# Altium project EMG-Arm-ELEC-V2.0.PrjPcb (part 2 of 4)

## Sheet Electrode_Sheet2.SchDoc
size 420 x 297 mm
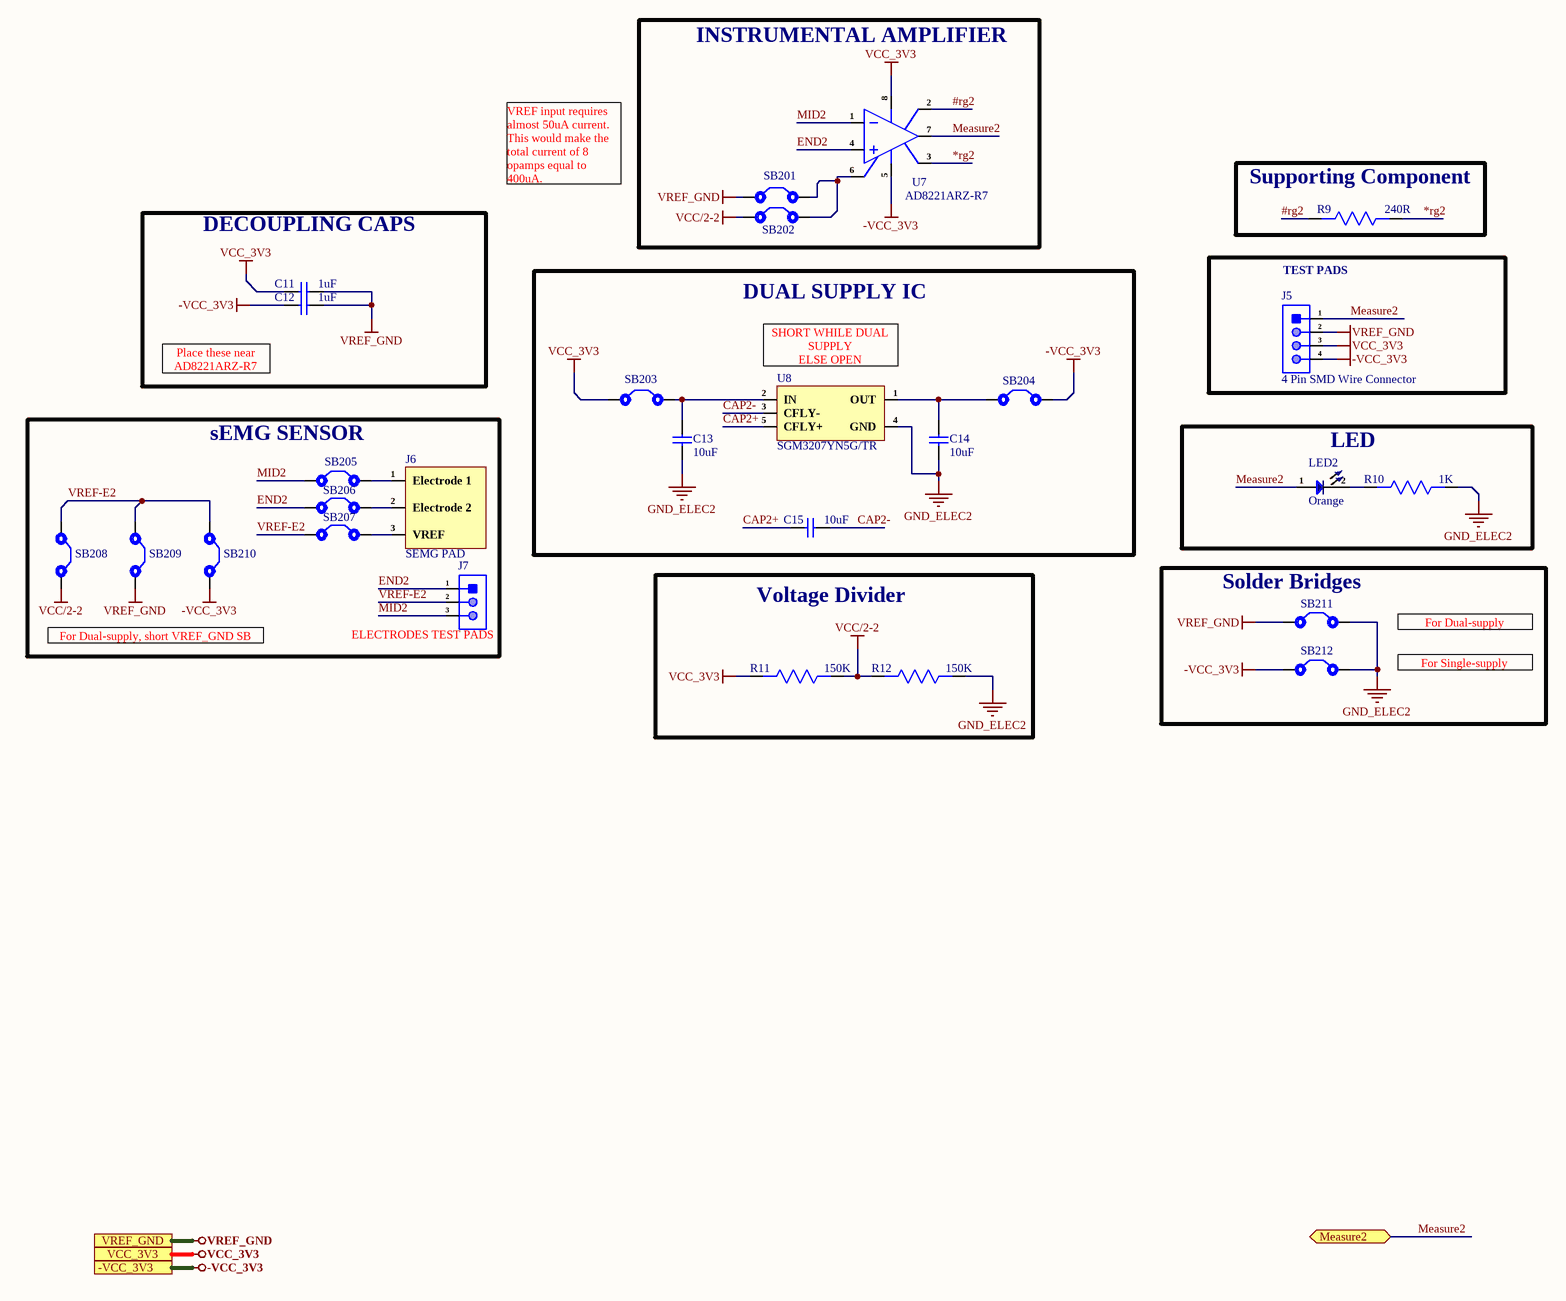
[diagram p4: Electrode_Sheet2.SchDoc]

### Parts
C11  1uF  [Cap-0402]
C12  1uF  [Cap-0402]
C13  10uF  [Cap-0603]
C14  10uF  [Cap-0603]
C15  10uF  [Cap-0603]
J5  4 Pin SMD Wire Connector  [4 Pin SMD Wire CON.]  (no BOM)
J6  SEMG PAD  [SEMG-PAD]
J7  Test Pad SMD 3 Pin  [Test Pad (SMD 3 Pin)]  (value not drawn)  (no BOM)
LED2  Orange  [LED-0603]
R9  240R  [Res-0402]
R10  1K  [Res-0402]
R11  150K  [Res-0402]
R12  150K  [Res-0402]
SB201  Solder Bridge 0402  [Solder Bridge 0402]  (value not drawn)  (no BOM)
SB202  Solder Bridge 0402  [Solder Bridge 0402]  (value not drawn)  (no BOM)
SB203  Solder Bridge 0402  [Solder Bridge 0402]  (value not drawn)  (no BOM)
SB204  Solder Bridge 0402  [Solder Bridge 0402]  (value not drawn)  (no BOM)
SB205  Solder Bridge 0402  [Solder Bridge 0402]  (value not drawn)  (no BOM)
SB206  Solder Bridge 0402  [Solder Bridge 0402]  (value not drawn)  (no BOM)
SB207  Solder Bridge 0402  [Solder Bridge 0402]  (value not drawn)  (no BOM)
SB208  Solder Bridge 0402  [Solder Bridge 0402]  (value not drawn)  (no BOM)
SB209  Solder Bridge 0402  [Solder Bridge 0402]  (value not drawn)  (no BOM)
SB210  Solder Bridge 0402  [Solder Bridge 0402]  (value not drawn)  (no BOM)
SB211  Solder Bridge 0402  [Solder Bridge 0402]  (value not drawn)  (no BOM)
SB212  Solder Bridge 0402  [Solder Bridge 0402]  (value not drawn)  (no BOM)
U7  AD8221ARZ-R7  [SOIC-8]
U8  SGM3207YN5G/TR  [SOT-23-5]

### Blocks framed on the sheet
INSTRUMENTAL AMPLIFIER: SB201 SB202 U7
Supporting Component: R9
DECOUPLING CAPS: C11 C12
TEST PADS: J5
DUAL SUPPLY IC: C13-C15 SB203 SB204 U8
sEMG SENSOR: J6 J7 SB205-SB210
LED: LED2 R10
Voltage Divider: R11 R12
Solder Bridges: SB211 SB212

### Ports
-VCC_3V3, Measure2 (bidir), VCC_3V3, VREF_GND

### Nets
-VCC_3V3: C12.1 J5.4 SB204.2 SB210.2 SB212.1 U7.5(V-) ; port -VCC_3V3
GND_ELEC2: C13.1 C14.1 R10.1 R12.2 SB211.2 SB212.2 U8.4(GND)
VCC/2-2: R11.2 R12.1 SB202.1 SB208.2
VCC_3V3: C11.1 J5.3 R11.1 SB203.1 U7.8(V+) ; port VCC_3V3
VREF_GND: C11.2 C12.2 J5.2 SB201.1 SB209.2 SB211.1 ; port VREF_GND
#rg2: R9.2 U7.2(RG)
*rg2: R9.1 U7.3(RG)
CAP2+: C15.1 U8.5(CFLY+)
CAP2-: C15.2 U8.3(CFLY-)
END2: J7.1 SB206.1 U7.4(IN+)
Measure2: J5.1 LED2.1 U7.7(VOUT) ; port Measure2
MID2: J7.3 SB205.1 U7.1(IN-)
VREF-E2: J7.2 SB207.1 SB208.1 SB209.1 SB210.1
NetC13_2: C13.2 SB203.2 U8.2(IN)
NetC14_2: C14.2 SB204.1 U8.1(OUT)
NetJ6_1: J6.1(Electrode_1) SB205.2
NetJ6_2: J6.2(Electrode_2) SB206.2
NetJ6_3: J6.3(VREF) SB207.2
NetLED2_2: LED2.2 R10.2
NetSB201_2: SB201.2 SB202.2 U7.6(REF)

### Notes on the sheet
- VREF input requires almost 50uA current. This would make the total current of 8 opamps equal to 400uA.
- Place these near AD8221ARZ-R7
- (near U8) SHORT WHILE DUAL SUPPLY
  ELSE OPEN
- For Dual-supply, short VREF_GND SB
- (near J7) ELECTRODES TEST PADS
- For Dual-supply
- For Single-supply
- File:
- Title:
- Date:
- Page
- Num:
- Total:
- Drawn By: Huzaifa Ali

### Library data of the parts
C11 C12 = CC0402KRX5R7BB105: CAP CER 1UF 16V X5R 0402; Manufacturer: Yageo; Tolerance: 10%; Item Type: Capacitor; Supplier 1: Digi-Key; Manufacturer Part Number: CC0402KRX5R7BB105; Stock 1: 1405667; Pricing 1: 1=0.36, 10=0.252, 100=0.1512, 500=0.1134, 1000=0.09576, 2500=0.09072, 5000=0.08568 (USD); Mount: Surface Mount; Case/Package: 0402; Weight: 2.3E-05oz; Case Code (Imperial): 0402; Case Code (Metric): 1005; Min Operating Temperature: -55°C; Max Operating Temperature: 85°C; Capacitance: 1uF; Dielectric: X5R; Packaging: Tape and Reel; Voltage Rating (DC): 16V; Voltage Rating: 16V; Termination: SMD/SMT; Composition: Ceramic; Length: 1mm; Height: 0.5mm; Width: 0.02inch; Thickness: 0.022inch; Depth: 0.5mm; Radiation Hardening: No; Lead Free: Lead Free; Halogen Free: Halogen Free; ComponentLink1URL: http://www.yageo.com/documents/recent/UPY-GPHC_X5R_4V-to-50V_12.pdf?src-supplier=Avnet+Europe; ComponentLink1Description: http://www.yageo.com/documents/recent/UPY-GPHC_X5R_4V-to-50V_12.pdf?src-supplier=Avnet+Europe; Supplier Part Number 1: 311-1691-6-ND; LCSC Part Number: C325464
C13-C15 = CL10A106MA8NRNC: CAP CER 10UF 25V X5R 0603; Manufacturer: Samsung; Tolerance: 20%; Supplier 1: Avnet; Manufacturer Part Number: CL10A106MA8NRNC; RoHS: Yes; Category: Ceramic Capacitors; Pricing 1: 4000=0.03753, 8000=0.03700, 16000=0.03595, 24000=0.03515, 32000=0.03383, 40000=0.03304, 400000=0.03225 (USD); Mount: Surface Mount; Case/Package: 0603; Case Code (Metric): 1608; Case Code (Imperial): 0603; Contact Plating: Tin; Min Operating Temperature: -55°C; Max Operating Temperature: 85°C; Package Quantity: 1; Packaging: Tape and Reel; Capacitance: 10uF; Voltage Rating: 25V; Dielectric: X5R; Termination: Wraparound; Series: CL; Construction: Flat; Length: 0.063inch; Width: 0.031inch; Thickness: 0.035inch; Lead Free: Lead Free; RoHS Compliant: Yes; ComponentLink1URL: https://datasheet.ciiva.com/25766/cl10a106ma8nrnc-25766562.pdf?src-supplier=Digi-Key; ComponentLink1Description: https://datasheet.ciiva.com/25766/cl10a106ma8nrnc-25766562.pdf?src-supplier=Digi-Key; Supplier Part Number 1: CL10A106MA8NRNC; LCSC Part Number: C96446
J5 = 4 Pin SMD Wire Connector: Wire Connecting Pads; Item Type: SMD Pads; Manufacturer Part Number: 4 Pin SMD Wire Connector
J6 = SEMG PAD: Sensor Connecting Pads
J7 = Test Pad SMD 3 Pin: Test Pad
LED2 = 19-217/S2C-AQ1R1B/3T: 0603(H=0.4mm) λD=600.5~612.5nm VR=5V VF=1.7V~2.2V IF=25mA PD=60mW; Manufacturer: Everlight; Item Type: LED; Supplier 1: Digi-Key; Manufacturer Part Number: 19-217/S2C-AQ1R1B/3T; RoHS: No; Category: LEDs; Supplier Part Number 1: 1080-19-217/S2C-AQ1R1B/3TTR-ND; LCSC Part Number: C146215; ComponentLink1Description: LCSC; ComponentLink1URL: https://www.lcsc.com/product-detail/Light-Emitting-Diodes-LED_Everlight-Elec-19-217-S2C-AQ1R1B-3T_C146215.html
R9 = RC0402FR-07240RL: RES 240 OHM 1% 1/16W 0402; Manufacturer: Yageo; Power Rating: 63mW; Temperature Coefficient: 100ppm/°C; Voltage Rating (DC): 50V; Supplier 1: Mouser; Manufacturer Part Number: RC0402FR-07240RL; RoHS: Yes; Category: Chip SMD Resistors; Stock 1: 1903202; Pricing 1: 1=0.10000, 10=0.01200, 50=0.01200, 100=0.00500, 1000=0.00300, 10000=0.00100 (USD); Case/Package: 0402; Case Code (Metric): 1005; Case Code (Imperial): 0402; Size Code: 0402; Min Operating Temperature: -55°C; Max Operating Temperature: 155°C; Resistance: 240R; Tolerance: 1%; Packaging: Tape and Reel; Resistor Type: Thick Film; Voltage Rating: 50V; Package Quantity: 1; Number of Terminations: 2; Termination: SMD/SMT; Max Power Dissipation: 63mW; Features: Moisture Resistant; Series: RC; Construction: Rectangular; Resistance Tolerance: 1%; Length: 1mm; Width: 0.02inch; Height: 0.016inch; Depth: 0.5mm; REACH SVHC: Unknown; Lead Free: Lead Free; RoHS Compliant: Yes; Military Standard: Not; ComponentLink1URL: https://datasheet.ciiva.com/7849/1018594-7849915.pdf?src-supplier=Element14; ComponentLink1Description: https://datasheet.ciiva.com/7849/1018594-7849915.pdf?src-supplier=Element14; ComponentLink2URL: https://datasheet.ciiva.com/7849/1018594-7849916.pdf?src-supplier=Element14; ComponentLink2Description: https://datasheet.ciiva.com/7849/1018594-7849916.pdf?src-supplier=Element14; ComponentLink3URL: https://datasheet.ciiva.com/2519/pyu-r-int-thick-7-2519157.pdf?src-supplier=Digi-Key; ComponentLink3Description: https://datasheet.ciiva.com/2519/pyu-r-int-thick-7-2519157.pdf?src-supplier=Digi-Key; ComponentLink4URL: https://datasheet.ciiva.com/2519/pyu-r-int-thick-7-2519158.pdf?src-supplier=Digi-Key; ComponentLink4Description: https://datasheet.ciiva.com/2519/pyu-r-int-thick-7-2519158.pdf?src-supplier=Digi-Key; ComponentLink5URL: https://datasheet.ciiva.com/2519/pyu-r-int-thick-7-2519156.pdf?src-supplier=Digi-Key; ComponentLink5Description: https://datasheet.ciiva.com/2519/pyu-r-int-thick-7-2519156.pdf?src-supplier=Digi-Key; ComponentLink6URL: https://datasheet.ciiva.com/12669/pyu-rc0402-51-rohs-l-6-r-12669689.pdf?src-supplier=Mouser; ComponentLink6Description: https://datasheet.ciiva.com/12669/pyu-rc0402-51-rohs-l-6-r-12669689.pdf?src-supplier=Mouser; ComponentLink7URL: https://datasheet.ciiva.com/17419/pyu-rc0402-51-rohs-l-6-r-17419482.pdf?src-supplier=Future+Electronics; ComponentLink7Description: https://datasheet.ciiva.com/17419/pyu-rc0402-51-rohs-l-6-r-17419482.pdf?src-supplier=Future+Electronics; Supplier Part Number 1: 603-RC0402FR-07240RL
R10 = RC0402JR-071KL: RES 1K OHM 5% 1/16W 0402; Manufacturer: Yageo; Resistance: 1kR; Power Rating: 62.5mW; Voltage Rating: 50V; Temperature Coefficient: 100ppm/°C; Max Power Dissipation: 63mW; Item Type: Resistor; Supplier 1: Digi-Key; Manufacturer Part Number: RC0402JR-071KL; RoHS: Yes; Category: Chip SMD Resistors; Stock 1: 452315; Pricing 1: 1=0.10000, 10=0.01300, 100=0.00540, 1000=0.00244, 2500=0.00212, 5000=0.00175 (USD); Case/Package: 0402; Case Code (Imperial): 0402; Case Code (Metric): 1005; Size Code: 0402; Min Operating Temperature: -55°C; Max Operating Temperature: 155°C; Tolerance: 5%; Packaging: Tape and Reel; Package Quantity: 1; Termination: SMD/SMT; Resistor Type: Thick Film; Number of Terminations: 2; Features: Moisture Resistant; Series: RC; Resistance Tolerance: 5%; Construction: Rectangular; Length: 0.039inch; Width: 0.02inch; Height: 0.016inch; Depth: 0.5mm; REACH SVHC: No SVHC; Military Standard: Not; Lead Free: Lead Free; RoHS Compliant: Yes; ComponentLink1URL: https://datasheet.ciiva.com/7983/1018594-7983558.pdf?src-supplier=Element14; ComponentLink1Description: https://datasheet.ciiva.com/7983/1018594-7983558.pdf?src-supplier=Element14; ComponentLink2URL: https://datasheet.ciiva.com/2452/pyu-r-int-thick-7-2452756.pdf?src-supplier=Digi-Key; ComponentLink2Description: https://datasheet.ciiva.com/2452/pyu-r-int-thick-7-2452756.pdf?src-supplier=Digi-Key; ComponentLink3URL: https://datasheet.ciiva.com/2452/pyu-r-int-thick-7-2452757.pdf?src-supplier=Digi-Key; ComponentLink3Description: https://datasheet.ciiva.com/2452/pyu-r-int-thick-7-2452757.pdf?src-supplier=Digi-Key; ComponentLink4URL: https://datasheet.ciiva.com/2452/pyu-r-int-thick-7-2452755.pdf?src-supplier=Digi-Key; ComponentLink4Description: https://datasheet.ciiva.com/2452/pyu-r-int-thick-7-2452755.pdf?src-supplier=Digi-Key; ComponentLink5URL: https://datasheet.ciiva.com/7850/1018594-7850170.pdf?src-supplier=Element14; ComponentLink5Description: https://datasheet.ciiva.com/7850/1018594-7850170.pdf?src-supplier=Element14; ComponentLink6URL: https://datasheet.ciiva.com/7850/1018594-7850171.pdf?src-supplier=Element14; ComponentLink6Description: https://datasheet.ciiva.com/7850/1018594-7850171.pdf?src-supplier=Element14; ComponentLink7URL: https://datasheet.ciiva.com/17081/pyu-rc0402-51-rohs-l-6-r-17081438.pdf?src-supplier=Future+Electronics; ComponentLink7Description: https://datasheet.ciiva.com/17081/pyu-rc0402-51-rohs-l-6-r-17081438.pdf?src-supplier=Future+Electronics; Supplier Part Number 1: 311-1.0KJRCT-ND; LCSC Part Number: C105637
R11 R12 = RC0402JR-07150KL: RES SMD 0402 150kOhm 5% Paper T/R; Manufacturer: Yageo; Resistance: 150kR; Power Rating: 63mW; Voltage Rating: 50V; Temperature Coefficient: 100ppm/°C; Item Type: Resistor; Supplier 1: Arrow Electronics; Manufacturer Part Number: RC0402JR-07150KL; RoHS: Yes; Category: Chip SMD Resistors; Stock 1: 170000; Pricing 1: 10000=0.00100 (USD); Case/Package: 0402; Case Code (Metric): 1005; Case Code (Imperial): 0402; Weight: 2.3E-05oz; Size Code: 0402; Min Operating Temperature: -55°C; Max Operating Temperature: 155°C; Package Quantity: 1; Tolerance: 5%; Packaging: Tape and Reel; Resistor Type: Thick Film; Number of Terminations: 2; Termination: SMD/SMT; Max Power Dissipation: 63mW; Features: Moisture Resistant; Series: RC; Construction: Rectangular; Resistance Tolerance: 5%; Length: 1mm; Width: 0.02inch; Height: 0.016inch; Depth: 0.5mm; REACH SVHC: No SVHC; Military Standard: Not; Lead Free: Lead Free; RoHS Compliant: Yes; ComponentLink1URL: https://datasheet.ciiva.com/7983/1018594-7983551.pdf?src-supplier=Element14; ComponentLink1Description: https://datasheet.ciiva.com/7983/1018594-7983551.pdf?src-supplier=Element14; ComponentLink2URL: https://datasheet.ciiva.com/2518/pyu-r-int-thick-7-2518929.pdf?src-supplier=Digi-Key; ComponentLink2Description: https://datasheet.ciiva.com/2518/pyu-r-int-thick-7-2518929.pdf?src-supplier=Digi-Key; ComponentLink3URL: https://datasheet.ciiva.com/2518/pyu-r-int-thick-7-2518930.pdf?src-supplier=Digi-Key; ComponentLink3Description: https://datasheet.ciiva.com/2518/pyu-r-int-thick-7-2518930.pdf?src-supplier=Digi-Key; ComponentLink4URL: https://datasheet.ciiva.com/2518/pyu-r-int-thick-7-2518928.pdf?src-supplier=Digi-Key; ComponentLink4Description: https://datasheet.ciiva.com/2518/pyu-r-int-thick-7-2518928.pdf?src-supplier=Digi-Key; ComponentLink5URL: https://datasheet.ciiva.com/7850/1018594-7850149.pdf?src-supplier=Element14; ComponentLink5Description: https://datasheet.ciiva.com/7850/1018594-7850149.pdf?src-supplier=Element14; ComponentLink6URL: https://datasheet.ciiva.com/17072/pyu-rc0402-51-rohs-l-6-r-17072379.pdf?src-supplier=Future+Electronics; ComponentLink6Description: https://datasheet.ciiva.com/17072/pyu-rc0402-51-rohs-l-6-r-17072379.pdf?src-supplier=Future+Electronics; ComponentLink7URL: https://datasheet.ciiva.com/15189/getdatasheetpartid-251830-15189543.pdf?src-supplier=Verical; ComponentLink7Description: https://datasheet.ciiva.com/15189/getdatasheetpartid-251830-15189543.pdf?src-supplier=Verical; Supplier Part Number 1: RC0402JR-07150KL; LCSC Part Number: C137919
SB201-SB212 = Solder Bridge 0402: Solder Bridge ON; Manufacturer Part Number: Solder Bridge 0402; Item Type: Solder Bridge
U7 = AD8221ARZ-R7: IC OPAMP INSTR 825KHZ 8SOIC; Manufacturer: Analog Devices; Number of Channels: 1; Common Mode Rejection Ratio: 80dB; Min Dual Supply Voltage: 2.3V; Max Dual Supply Voltage: 18V; Slew Rate: 2.5V/µs; Nominal Supply Current: 1mA; Max Power Dissipation: 200mW; Bandwidth: 562kHz; Input Bias Current: 1.5nA; Input Offset Voltage (Vos): 60uV; Output Current per Channel: 18mA; Power Supply Rejection Ratio (PSRR): 130dB; Voltage Gain: 60dB; Input Resistance: 100GR; Quiescent Current: 900uA; Operating Supply Voltage: 36V; Supplier 1: Mouser; Manufacturer Part Number: AD8221ARZ-R7; RoHS: Yes; Category: Amplifiers - Op Amps, Buffer, Instrumentation; Pricing 1: 1=7.37000, 10=6.66000, 25=6.35000, 50=6.35000, 100=5.51000, 250=5.27000, 500=4.80000, 1000=4.37000, 10000=4.37000 (USD); Case/Package: SOIC; Number of Pins: 8; Contact Plating: Tin,Matte; Min Operating Temperature: -40°C; Max Operating Temperature: 85°C; -3db Bandwidth: 825kHz; Package Quantity: 1000; Packaging: Tape and Reel; Number of Circuits: 1; Operating Supply Current: 1mA; Number of Elements: 1; Power Dissipation: 200mW; Series: -; Supply Current: 1mA; Radiation Hardening: No; Lead Free: Contains Lead; RoHS Compliant: Yes; ComponentLink1URL: https://datasheet.ciiva.com/15128/getdatasheetpartid-313520-15128733.pdf?src-supplier=Verical; ComponentLink1Description: https://datasheet.ciiva.com/15128/getdatasheetpartid-313520-15128733.pdf?src-supplier=Verical; ComponentLink2URL: https://datasheet.ciiva.com/2975/ad8221-2975658.pdf?src-supplier=Avnet; ComponentLink2Description: https://datasheet.ciiva.com/2975/ad8221-2975658.pdf?src-supplier=Avnet; ComponentLink3URL: https://datasheet.ciiva.com/2975/ad8221-2975980.pdf?src-supplier=Avnet; ComponentLink3Description: https://datasheet.ciiva.com/2975/ad8221-2975980.pdf?src-supplier=Avnet; ComponentLink4URL: https://datasheet.ciiva.com/6628/ad8221-6628618.pdf?src-supplier=Digi-Key; ComponentLink4Description: https://datasheet.ciiva.com/6628/ad8221-6628618.pdf?src-supplier=Digi-Key; ComponentLink5URL: https://datasheet.ciiva.com/6628/ad8221-6628619.pdf?src-supplier=Digi-Key; ComponentLink5Description: https://datasheet.ciiva.com/6628/ad8221-6628619.pdf?src-supplier=Digi-Key; ComponentLink6URL: https://datasheet.ciiva.com/6628/ad8221-6628617.pdf?src-supplier=Digi-Key; ComponentLink6Description: https://datasheet.ciiva.com/6628/ad8221-6628617.pdf?src-supplier=Digi-Key; ComponentLink7URL: https://datasheet.ciiva.com/48709/001249009-da-01-en-ic-amp-inst-prec-ad8221arz-r7-soic-8-adi-48709526.pdf?src-supplier=Conrad; ComponentLink7Description: https://datasheet.ciiva.com/48709/001249009-da-01-en-ic-amp-inst-prec-ad8221arz-r7-soic-8-adi-48709526.pdf?src-supplier=Conrad; Supplier Part Number 1: 584-AD8221ARZ-R7; LCSC Part Number: C13342; Item Type: IC
U8 = SGM3207YN5G/TR: NO Charge pump 1 -5.5V~-1.4V 1.4V~5.5V 60mA 19kHz SOT-23-5 DC-DC Converters ROHS; Manufacturer: SG Micro; Item Type: IC; Supplier 1: Avnet; Manufacturer Part Number: SGM3207YN5G/TR; RoHS: No; Category: Uncategorized; Pricing 1: 3000=0.38750, 6000=0.36250, 12000=0.33750, 18000=0.32500, 24000=0.31250, 30000=0.31250, 300000=0.30500 (USD); LCSC Part Number: C80403; Supplier Part Number 1: SGM3207YN5G/TR

## Sheet Electrode_Sheet3.SchDoc
size 420 x 297 mm
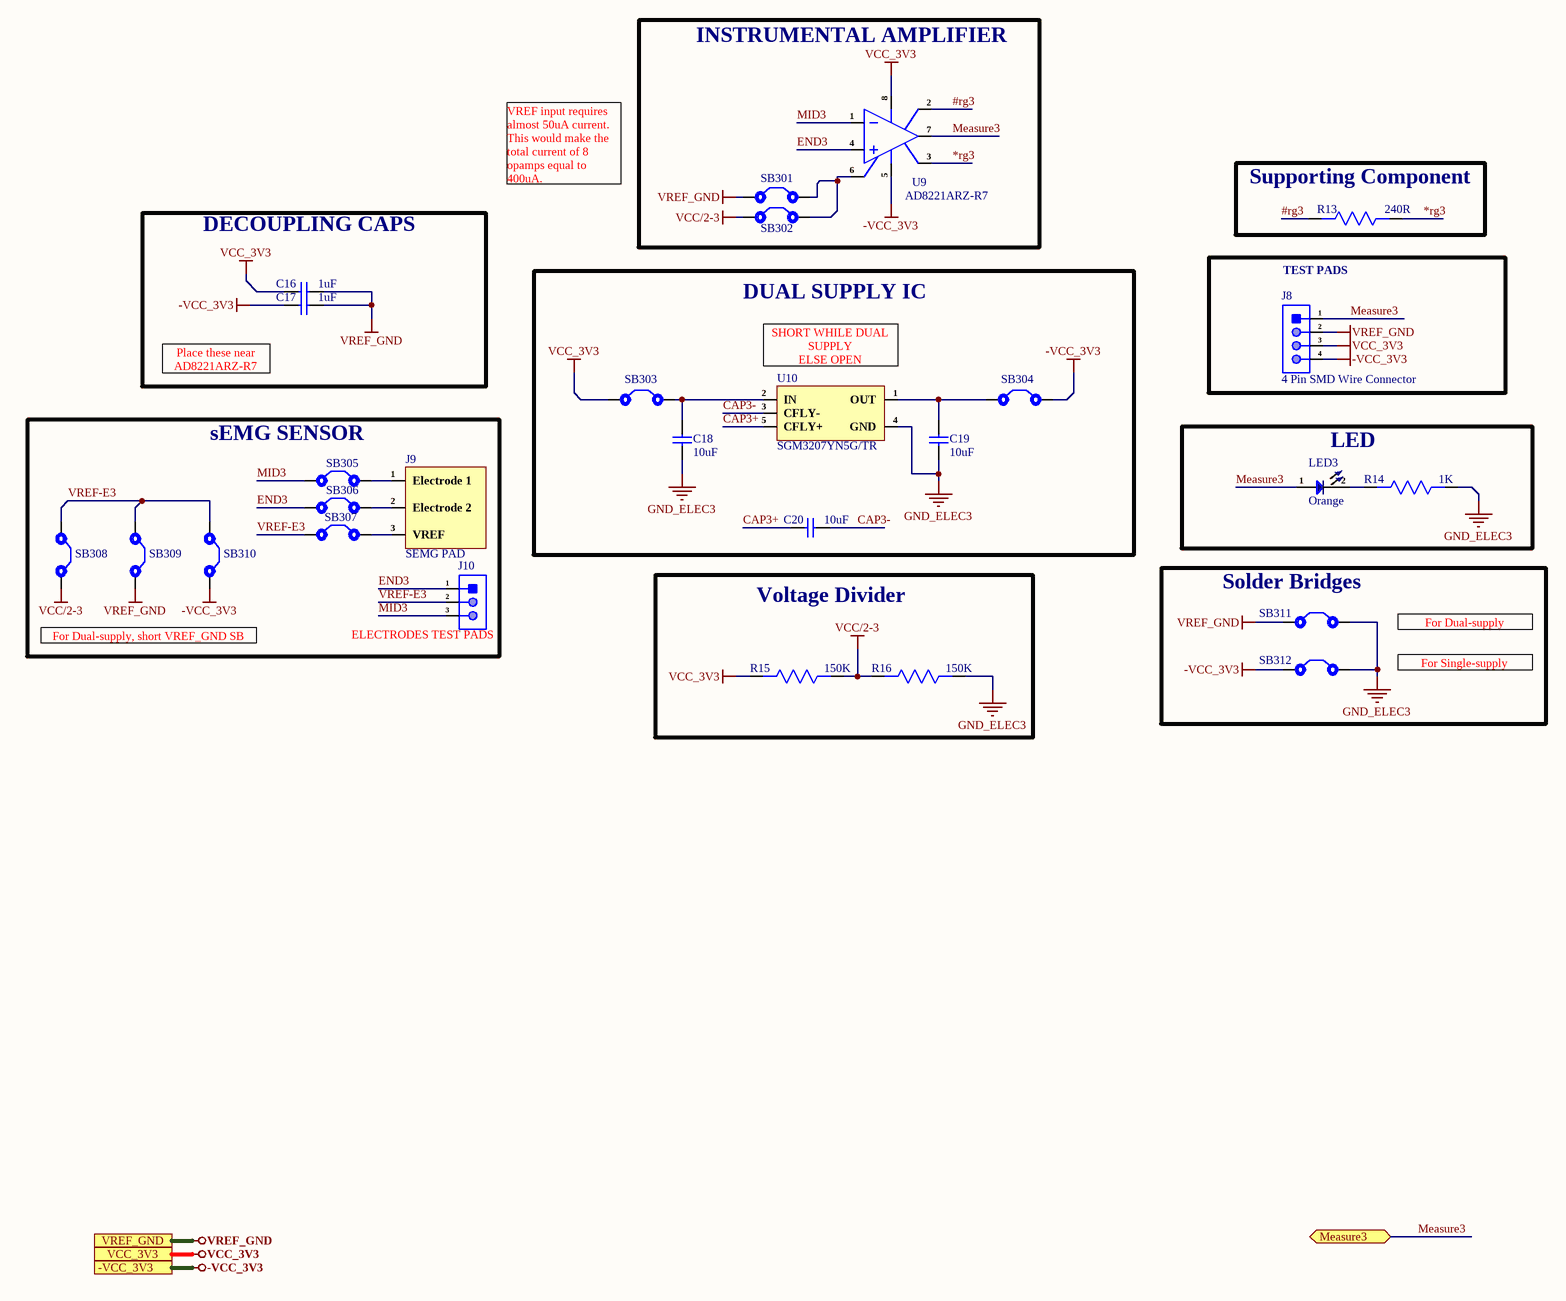
[diagram p5: Electrode_Sheet3.SchDoc]

### Parts
C16  1uF  [Cap-0402]
C17  1uF  [Cap-0402]
C18  10uF  [Cap-0603]
C19  10uF  [Cap-0603]
C20  10uF  [Cap-0603]
J8  4 Pin SMD Wire Connector  [4 Pin SMD Wire CON.]  (no BOM)
J9  SEMG PAD  [SEMG-PAD]
J10  Test Pad SMD 3 Pin  [Test Pad (SMD 3 Pin)]  (value not drawn)  (no BOM)
LED3  Orange  [LED-0603]
R13  240R  [Res-0402]
R14  1K  [Res-0402]
R15  150K  [Res-0402]
R16  150K  [Res-0402]
SB301  Solder Bridge 0402  [Solder Bridge 0402]  (value not drawn)  (no BOM)
SB302  Solder Bridge 0402  [Solder Bridge 0402]  (value not drawn)  (no BOM)
SB303  Solder Bridge 0402  [Solder Bridge 0402]  (value not drawn)  (no BOM)
SB304  Solder Bridge 0402  [Solder Bridge 0402]  (value not drawn)  (no BOM)
SB305  Solder Bridge 0402  [Solder Bridge 0402]  (value not drawn)  (no BOM)
SB306  Solder Bridge 0402  [Solder Bridge 0402]  (value not drawn)  (no BOM)
SB307  Solder Bridge 0402  [Solder Bridge 0402]  (value not drawn)  (no BOM)
SB308  Solder Bridge 0402  [Solder Bridge 0402]  (value not drawn)  (no BOM)
SB309  Solder Bridge 0402  [Solder Bridge 0402]  (value not drawn)  (no BOM)
SB310  Solder Bridge 0402  [Solder Bridge 0402]  (value not drawn)  (no BOM)
SB311  Solder Bridge 0402  [Solder Bridge 0402]  (value not drawn)  (no BOM)
SB312  Solder Bridge 0402  [Solder Bridge 0402]  (value not drawn)  (no BOM)
U9  AD8221ARZ-R7  [SOIC-8]
U10  SGM3207YN5G/TR  [SOT-23-5]

### Blocks framed on the sheet
INSTRUMENTAL AMPLIFIER: SB301 SB302 U9
Supporting Component: R13
DECOUPLING CAPS: C16 C17
TEST PADS: J8
DUAL SUPPLY IC: C18-C20 SB303 SB304 U10
sEMG SENSOR: J9 J10 SB305-SB310
LED: LED3 R14
Voltage Divider: R15 R16
Solder Bridges: SB311 SB312

### Ports
-VCC_3V3, Measure3 (bidir), VCC_3V3, VREF_GND

### Nets
-VCC_3V3: C17.1 J8.4 SB304.2 SB310.2 SB312.1 U9.5(V-) ; port -VCC_3V3
GND_ELEC3: C18.1 C19.1 R14.1 R16.2 SB311.2 SB312.2 U10.4(GND)
VCC/2-3: R15.2 R16.1 SB302.1 SB308.2
VCC_3V3: C16.1 J8.3 R15.1 SB303.1 U9.8(V+) ; port VCC_3V3
VREF_GND: C16.2 C17.2 J8.2 SB301.1 SB309.2 SB311.1 ; port VREF_GND
#rg3: R13.2 U9.2(RG)
*rg3: R13.1 U9.3(RG)
CAP3+: C20.1 U10.5(CFLY+)
CAP3-: C20.2 U10.3(CFLY-)
END3: J10.1 SB306.1 U9.4(IN+)
Measure3: J8.1 LED3.1 U9.7(VOUT) ; port Measure3
MID3: J10.3 SB305.1 U9.1(IN-)
VREF-E3: J10.2 SB307.1 SB308.1 SB309.1 SB310.1
NetC18_2: C18.2 SB303.2 U10.2(IN)
NetC19_2: C19.2 SB304.1 U10.1(OUT)
NetJ9_1: J9.1(Electrode_1) SB305.2
NetJ9_2: J9.2(Electrode_2) SB306.2
NetJ9_3: J9.3(VREF) SB307.2
NetLED3_2: LED3.2 R14.2
NetSB301_2: SB301.2 SB302.2 U9.6(REF)

### Notes on the sheet
- VREF input requires almost 50uA current. This would make the total current of 8 opamps equal to 400uA.
- Place these near AD8221ARZ-R7
- (near U10) SHORT WHILE DUAL SUPPLY
  ELSE OPEN
- For Dual-supply, short VREF_GND SB
- (near J10) ELECTRODES TEST PADS
- For Dual-supply
- For Single-supply
- File:
- Title:
- Date:
- Page
- Num:
- Total:
- Drawn By: Huzaifa Ali

### Library data of the parts
C16 C17 = CC0402KRX5R7BB105: as C11 on sheet Electrode_Sheet2; Supplier 1: Digi-Key; Manufacturer Part Number: CC0402KRX5R7BB105; Stock 1: 1405667; Pricing 1: 1=0.36, 10=0.252, 100=0.1512, 500=0.1134, 1000=0.09576, 2500=0.09072, 5000=0.08568 (USD); Mount: Surface Mount; Case/Package: 0402; Weight: 2.3E-05oz; Case Code (Imperial): 0402; Case Code (Metric): 1005; Min Operating Temperature: -55°C; Max Operating Temperature: 85°C; Capacitance: 1uF; Dielectric: X5R; Packaging: Tape and Reel; Voltage Rating (DC): 16V; Voltage Rating: 16V; Termination: SMD/SMT; Composition: Ceramic; Length: 1mm; Height: 0.5mm; Width: 0.02inch; Thickness: 0.022inch; Depth: 0.5mm; Radiation Hardening: No; Lead Free: Lead Free; Halogen Free: Halogen Free; ComponentLink1URL: http://www.yageo.com/documents/recent/UPY-GPHC_X5R_4V-to-50V_12.pdf?src-supplier=Avnet+Europe; ComponentLink1Description: http://www.yageo.com/documents/recent/UPY-GPHC_X5R_4V-to-50V_12.pdf?src-supplier=Avnet+Europe; Supplier Part Number 1: 311-1691-6-ND; LCSC Part Number: C325464
C18-C20 = CL10A106MA8NRNC: as C13 on sheet Electrode_Sheet2; Supplier 1: Avnet; Manufacturer Part Number: CL10A106MA8NRNC; RoHS: Yes; Category: Ceramic Capacitors; Pricing 1: 4000=0.03753, 8000=0.03700, 16000=0.03595, 24000=0.03515, 32000=0.03383, 40000=0.03304, 400000=0.03225 (USD); Mount: Surface Mount; Case/Package: 0603; Case Code (Metric): 1608; Case Code (Imperial): 0603; Contact Plating: Tin; Min Operating Temperature: -55°C; Max Operating Temperature: 85°C; Package Quantity: 1; Packaging: Tape and Reel; Capacitance: 10uF; Voltage Rating: 25V; Dielectric: X5R; Termination: Wraparound; Series: CL; Construction: Flat; Length: 0.063inch; Width: 0.031inch; Thickness: 0.035inch; Lead Free: Lead Free; RoHS Compliant: Yes; ComponentLink1URL: https://datasheet.ciiva.com/25766/cl10a106ma8nrnc-25766562.pdf?src-supplier=Digi-Key; ComponentLink1Description: https://datasheet.ciiva.com/25766/cl10a106ma8nrnc-25766562.pdf?src-supplier=Digi-Key; Supplier Part Number 1: CL10A106MA8NRNC; LCSC Part Number: C96446
J8 = 4 Pin SMD Wire Connector: as J5 on sheet Electrode_Sheet2; Manufacturer Part Number: 4 Pin SMD Wire Connector
J9 = SEMG PAD: Sensor Connecting Pads
J10 = Test Pad SMD 3 Pin: Test Pad
LED3 = 19-217/S2C-AQ1R1B/3T: as LED2 on sheet Electrode_Sheet2; Supplier 1: Digi-Key; Manufacturer Part Number: 19-217/S2C-AQ1R1B/3T; RoHS: No; Category: LEDs; Supplier Part Number 1: 1080-19-217/S2C-AQ1R1B/3TTR-ND; LCSC Part Number: C146215; ComponentLink1Description: LCSC; ComponentLink1URL: https://www.lcsc.com/product-detail/Light-Emitting-Diodes-LED_Everlight-Elec-19-217-S2C-AQ1R1B-3T_C146215.html
R13 = RC0402FR-07240RL: as R9 on sheet Electrode_Sheet2; Supplier 1: Mouser; Manufacturer Part Number: RC0402FR-07240RL; RoHS: Yes; Category: Chip SMD Resistors; Stock 1: 1903202; Pricing 1: 1=0.10000, 10=0.01200, 50=0.01200, 100=0.00500, 1000=0.00300, 10000=0.00100 (USD); Case/Package: 0402; Case Code (Metric): 1005; Case Code (Imperial): 0402; Size Code: 0402; Min Operating Temperature: -55°C; Max Operating Temperature: 155°C; Resistance: 240R; Tolerance: 1%; Packaging: Tape and Reel; Resistor Type: Thick Film; Voltage Rating: 50V; Package Quantity: 1; Number of Terminations: 2; Termination: SMD/SMT; Max Power Dissipation: 63mW; Features: Moisture Resistant; Series: RC; Construction: Rectangular; Resistance Tolerance: 1%; Length: 1mm; Width: 0.02inch; Height: 0.016inch; Depth: 0.5mm; REACH SVHC: Unknown; Lead Free: Lead Free; RoHS Compliant: Yes; Military Standard: Not; ComponentLink1URL: https://datasheet.ciiva.com/7849/1018594-7849915.pdf?src-supplier=Element14; ComponentLink1Description: https://datasheet.ciiva.com/7849/1018594-7849915.pdf?src-supplier=Element14; ComponentLink2URL: https://datasheet.ciiva.com/7849/1018594-7849916.pdf?src-supplier=Element14; ComponentLink2Description: https://datasheet.ciiva.com/7849/1018594-7849916.pdf?src-supplier=Element14; ComponentLink3URL: https://datasheet.ciiva.com/2519/pyu-r-int-thick-7-2519157.pdf?src-supplier=Digi-Key; ComponentLink3Description: https://datasheet.ciiva.com/2519/pyu-r-int-thick-7-2519157.pdf?src-supplier=Digi-Key; ComponentLink4URL: https://datasheet.ciiva.com/2519/pyu-r-int-thick-7-2519158.pdf?src-supplier=Digi-Key; ComponentLink4Description: https://datasheet.ciiva.com/2519/pyu-r-int-thick-7-2519158.pdf?src-supplier=Digi-Key; ComponentLink5URL: https://datasheet.ciiva.com/2519/pyu-r-int-thick-7-2519156.pdf?src-supplier=Digi-Key; ComponentLink5Description: https://datasheet.ciiva.com/2519/pyu-r-int-thick-7-2519156.pdf?src-supplier=Digi-Key; ComponentLink6URL: https://datasheet.ciiva.com/12669/pyu-rc0402-51-rohs-l-6-r-12669689.pdf?src-supplier=Mouser; ComponentLink6Description: https://datasheet.ciiva.com/12669/pyu-rc0402-51-rohs-l-6-r-12669689.pdf?src-supplier=Mouser; ComponentLink7URL: https://datasheet.ciiva.com/17419/pyu-rc0402-51-rohs-l-6-r-17419482.pdf?src-supplier=Future+Electronics; ComponentLink7Description: https://datasheet.ciiva.com/17419/pyu-rc0402-51-rohs-l-6-r-17419482.pdf?src-supplier=Future+Electronics; Supplier Part Number 1: 603-RC0402FR-07240RL
R14 = RC0402JR-071KL: as R10 on sheet Electrode_Sheet2; Supplier 1: Digi-Key; Manufacturer Part Number: RC0402JR-071KL; RoHS: Yes; Category: Chip SMD Resistors; Stock 1: 452315; Pricing 1: 1=0.10000, 10=0.01300, 100=0.00540, 1000=0.00244, 2500=0.00212, 5000=0.00175 (USD); Case/Package: 0402; Case Code (Imperial): 0402; Case Code (Metric): 1005; Size Code: 0402; Min Operating Temperature: -55°C; Max Operating Temperature: 155°C; Tolerance: 5%; Packaging: Tape and Reel; Package Quantity: 1; Termination: SMD/SMT; Resistor Type: Thick Film; Number of Terminations: 2; Features: Moisture Resistant; Series: RC; Resistance Tolerance: 5%; Construction: Rectangular; Length: 0.039inch; Width: 0.02inch; Height: 0.016inch; Depth: 0.5mm; REACH SVHC: No SVHC; Military Standard: Not; Lead Free: Lead Free; RoHS Compliant: Yes; ComponentLink1URL: https://datasheet.ciiva.com/7983/1018594-7983558.pdf?src-supplier=Element14; ComponentLink1Description: https://datasheet.ciiva.com/7983/1018594-7983558.pdf?src-supplier=Element14; ComponentLink2URL: https://datasheet.ciiva.com/2452/pyu-r-int-thick-7-2452756.pdf?src-supplier=Digi-Key; ComponentLink2Description: https://datasheet.ciiva.com/2452/pyu-r-int-thick-7-2452756.pdf?src-supplier=Digi-Key; ComponentLink3URL: https://datasheet.ciiva.com/2452/pyu-r-int-thick-7-2452757.pdf?src-supplier=Digi-Key; ComponentLink3Description: https://datasheet.ciiva.com/2452/pyu-r-int-thick-7-2452757.pdf?src-supplier=Digi-Key; ComponentLink4URL: https://datasheet.ciiva.com/2452/pyu-r-int-thick-7-2452755.pdf?src-supplier=Digi-Key; ComponentLink4Description: https://datasheet.ciiva.com/2452/pyu-r-int-thick-7-2452755.pdf?src-supplier=Digi-Key; ComponentLink5URL: https://datasheet.ciiva.com/7850/1018594-7850170.pdf?src-supplier=Element14; ComponentLink5Description: https://datasheet.ciiva.com/7850/1018594-7850170.pdf?src-supplier=Element14; ComponentLink6URL: https://datasheet.ciiva.com/7850/1018594-7850171.pdf?src-supplier=Element14; ComponentLink6Description: https://datasheet.ciiva.com/7850/1018594-7850171.pdf?src-supplier=Element14; ComponentLink7URL: https://datasheet.ciiva.com/17081/pyu-rc0402-51-rohs-l-6-r-17081438.pdf?src-supplier=Future+Electronics; ComponentLink7Description: https://datasheet.ciiva.com/17081/pyu-rc0402-51-rohs-l-6-r-17081438.pdf?src-supplier=Future+Electronics; Supplier Part Number 1: 311-1.0KJRCT-ND; LCSC Part Number: C105637
R15 R16 = RC0402JR-07150KL: as R11 on sheet Electrode_Sheet2; Supplier 1: Arrow Electronics; Manufacturer Part Number: RC0402JR-07150KL; RoHS: Yes; Category: Chip SMD Resistors; Stock 1: 170000; Pricing 1: 10000=0.00100 (USD); Case/Package: 0402; Case Code (Metric): 1005; Case Code (Imperial): 0402; Weight: 2.3E-05oz; Size Code: 0402; Min Operating Temperature: -55°C; Max Operating Temperature: 155°C; Package Quantity: 1; Tolerance: 5%; Packaging: Tape and Reel; Resistor Type: Thick Film; Number of Terminations: 2; Termination: SMD/SMT; Max Power Dissipation: 63mW; Features: Moisture Resistant; Series: RC; Construction: Rectangular; Resistance Tolerance: 5%; Length: 1mm; Width: 0.02inch; Height: 0.016inch; Depth: 0.5mm; REACH SVHC: No SVHC; Military Standard: Not; Lead Free: Lead Free; RoHS Compliant: Yes; ComponentLink1URL: https://datasheet.ciiva.com/7983/1018594-7983551.pdf?src-supplier=Element14; ComponentLink1Description: https://datasheet.ciiva.com/7983/1018594-7983551.pdf?src-supplier=Element14; ComponentLink2URL: https://datasheet.ciiva.com/2518/pyu-r-int-thick-7-2518929.pdf?src-supplier=Digi-Key; ComponentLink2Description: https://datasheet.ciiva.com/2518/pyu-r-int-thick-7-2518929.pdf?src-supplier=Digi-Key; ComponentLink3URL: https://datasheet.ciiva.com/2518/pyu-r-int-thick-7-2518930.pdf?src-supplier=Digi-Key; ComponentLink3Description: https://datasheet.ciiva.com/2518/pyu-r-int-thick-7-2518930.pdf?src-supplier=Digi-Key; ComponentLink4URL: https://datasheet.ciiva.com/2518/pyu-r-int-thick-7-2518928.pdf?src-supplier=Digi-Key; ComponentLink4Description: https://datasheet.ciiva.com/2518/pyu-r-int-thick-7-2518928.pdf?src-supplier=Digi-Key; ComponentLink5URL: https://datasheet.ciiva.com/7850/1018594-7850149.pdf?src-supplier=Element14; ComponentLink5Description: https://datasheet.ciiva.com/7850/1018594-7850149.pdf?src-supplier=Element14; ComponentLink6URL: https://datasheet.ciiva.com/17072/pyu-rc0402-51-rohs-l-6-r-17072379.pdf?src-supplier=Future+Electronics; ComponentLink6Description: https://datasheet.ciiva.com/17072/pyu-rc0402-51-rohs-l-6-r-17072379.pdf?src-supplier=Future+Electronics; ComponentLink7URL: https://datasheet.ciiva.com/15189/getdatasheetpartid-251830-15189543.pdf?src-supplier=Verical; ComponentLink7Description: https://datasheet.ciiva.com/15189/getdatasheetpartid-251830-15189543.pdf?src-supplier=Verical; Supplier Part Number 1: RC0402JR-07150KL; LCSC Part Number: C137919
SB301-SB312 = Solder Bridge 0402: Solder Bridge ON; Manufacturer Part Number: Solder Bridge 0402; Item Type: Solder Bridge
U9 = AD8221ARZ-R7: as U7 on sheet Electrode_Sheet2; Supplier 1: Mouser; Manufacturer Part Number: AD8221ARZ-R7; RoHS: Yes; Category: Amplifiers - Op Amps, Buffer, Instrumentation; Pricing 1: 1=7.37000, 10=6.66000, 25=6.35000, 50=6.35000, 100=5.51000, 250=5.27000, 500=4.80000, 1000=4.37000, 10000=4.37000 (USD); Case/Package: SOIC; Number of Pins: 8; Contact Plating: Tin,Matte; Min Operating Temperature: -40°C; Max Operating Temperature: 85°C; -3db Bandwidth: 825kHz; Package Quantity: 1000; Packaging: Tape and Reel; Number of Circuits: 1; Operating Supply Current: 1mA; Number of Elements: 1; Power Dissipation: 200mW; Series: -; Supply Current: 1mA; Radiation Hardening: No; Lead Free: Contains Lead; RoHS Compliant: Yes; ComponentLink1URL: https://datasheet.ciiva.com/15128/getdatasheetpartid-313520-15128733.pdf?src-supplier=Verical; ComponentLink1Description: https://datasheet.ciiva.com/15128/getdatasheetpartid-313520-15128733.pdf?src-supplier=Verical; ComponentLink2URL: https://datasheet.ciiva.com/2975/ad8221-2975658.pdf?src-supplier=Avnet; ComponentLink2Description: https://datasheet.ciiva.com/2975/ad8221-2975658.pdf?src-supplier=Avnet; ComponentLink3URL: https://datasheet.ciiva.com/2975/ad8221-2975980.pdf?src-supplier=Avnet; ComponentLink3Description: https://datasheet.ciiva.com/2975/ad8221-2975980.pdf?src-supplier=Avnet; ComponentLink4URL: https://datasheet.ciiva.com/6628/ad8221-6628618.pdf?src-supplier=Digi-Key; ComponentLink4Description: https://datasheet.ciiva.com/6628/ad8221-6628618.pdf?src-supplier=Digi-Key; ComponentLink5URL: https://datasheet.ciiva.com/6628/ad8221-6628619.pdf?src-supplier=Digi-Key; ComponentLink5Description: https://datasheet.ciiva.com/6628/ad8221-6628619.pdf?src-supplier=Digi-Key; ComponentLink6URL: https://datasheet.ciiva.com/6628/ad8221-6628617.pdf?src-supplier=Digi-Key; ComponentLink6Description: https://datasheet.ciiva.com/6628/ad8221-6628617.pdf?src-supplier=Digi-Key; ComponentLink7URL: https://datasheet.ciiva.com/48709/001249009-da-01-en-ic-amp-inst-prec-ad8221arz-r7-soic-8-adi-48709526.pdf?src-supplier=Conrad; ComponentLink7Description: https://datasheet.ciiva.com/48709/001249009-da-01-en-ic-amp-inst-prec-ad8221arz-r7-soic-8-adi-48709526.pdf?src-supplier=Conrad; Supplier Part Number 1: 584-AD8221ARZ-R7; LCSC Part Number: C13342; Item Type: IC
U10 = SGM3207YN5G/TR: as U8 on sheet Electrode_Sheet2; Supplier 1: Avnet; Manufacturer Part Number: SGM3207YN5G/TR; RoHS: No; Category: Uncategorized; Pricing 1: 3000=0.38750, 6000=0.36250, 12000=0.33750, 18000=0.32500, 24000=0.31250, 30000=0.31250, 300000=0.30500 (USD); LCSC Part Number: C80403; Supplier Part Number 1: SGM3207YN5G/TR

## Sheet Electrode_Sheet4.SchDoc
size 420 x 297 mm
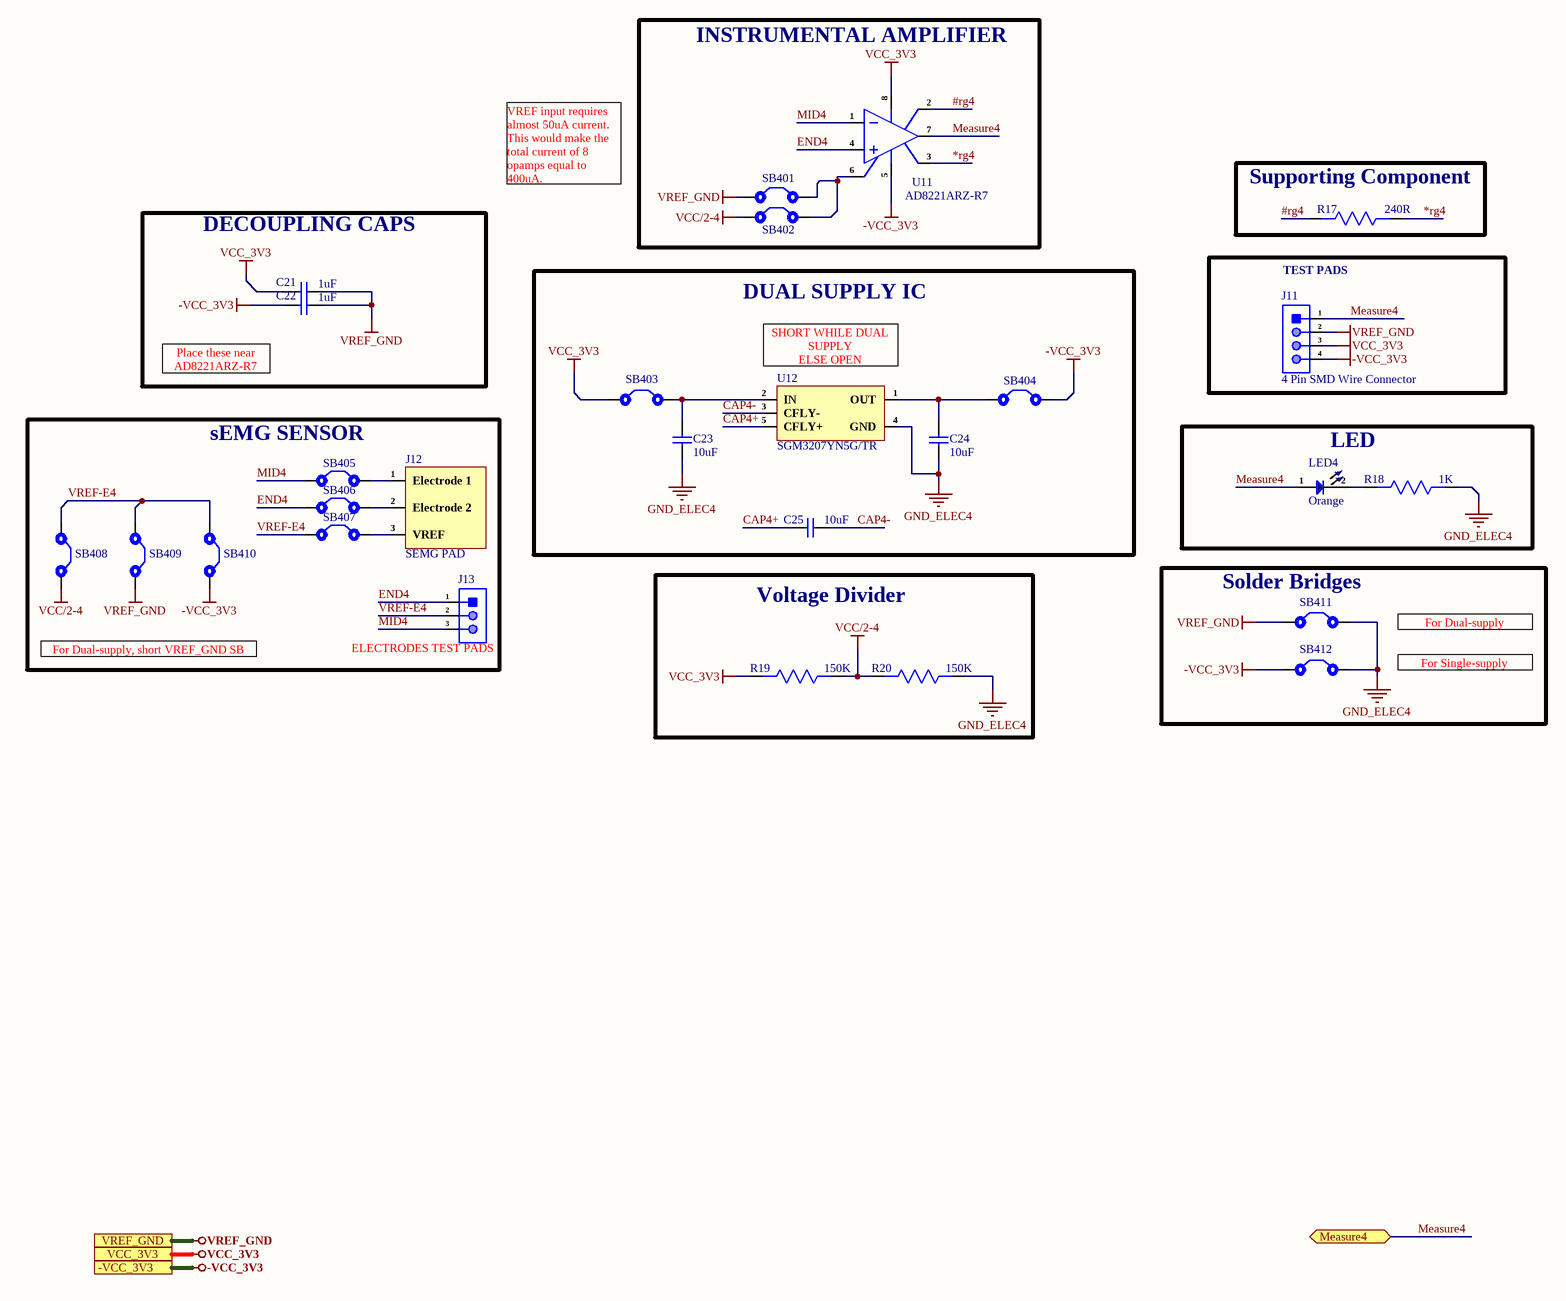
[diagram p6: Electrode_Sheet4.SchDoc]

### Parts
C21  1uF  [Cap-0402]
C22  1uF  [Cap-0402]
C23  10uF  [Cap-0603]
C24  10uF  [Cap-0603]
C25  10uF  [Cap-0603]
J11  4 Pin SMD Wire Connector  [4 Pin SMD Wire CON.]  (no BOM)
J12  SEMG PAD  [SEMG-PAD]
J13  Test Pad SMD 3 Pin  [Test Pad (SMD 3 Pin)]  (value not drawn)  (no BOM)
LED4  Orange  [LED-0603]
R17  240R  [Res-0402]
R18  1K  [Res-0402]
R19  150K  [Res-0402]
R20  150K  [Res-0402]
SB401  Solder Bridge 0402  [Solder Bridge 0402]  (value not drawn)  (no BOM)
SB402  Solder Bridge 0402  [Solder Bridge 0402]  (value not drawn)  (no BOM)
SB403  Solder Bridge 0402  [Solder Bridge 0402]  (value not drawn)  (no BOM)
SB404  Solder Bridge 0402  [Solder Bridge 0402]  (value not drawn)  (no BOM)
SB405  Solder Bridge 0402  [Solder Bridge 0402]  (value not drawn)  (no BOM)
SB406  Solder Bridge 0402  [Solder Bridge 0402]  (value not drawn)  (no BOM)
SB407  Solder Bridge 0402  [Solder Bridge 0402]  (value not drawn)  (no BOM)
SB408  Solder Bridge 0402  [Solder Bridge 0402]  (value not drawn)  (no BOM)
SB409  Solder Bridge 0402  [Solder Bridge 0402]  (value not drawn)  (no BOM)
SB410  Solder Bridge 0402  [Solder Bridge 0402]  (value not drawn)  (no BOM)
SB411  Solder Bridge 0402  [Solder Bridge 0402]  (value not drawn)  (no BOM)
SB412  Solder Bridge 0402  [Solder Bridge 0402]  (value not drawn)  (no BOM)
U11  AD8221ARZ-R7  [SOIC-8]
U12  SGM3207YN5G/TR  [SOT-23-5]

### Blocks framed on the sheet
INSTRUMENTAL AMPLIFIER: SB401 SB402 U11
Supporting Component: R17
DECOUPLING CAPS: C21 C22
TEST PADS: J11
DUAL SUPPLY IC: C23-C25 SB403 SB404 U12
sEMG SENSOR: J12 J13 SB405-SB410
LED: LED4 R18
Voltage Divider: R19 R20
Solder Bridges: SB411 SB412

### Ports
-VCC_3V3, Measure4 (bidir), VCC_3V3, VREF_GND

### Nets
-VCC_3V3: C22.1 J11.4 SB404.2 SB410.2 SB412.1 U11.5(V-) ; port -VCC_3V3
GND_ELEC4: C23.1 C24.1 R18.1 R20.2 SB411.2 SB412.2 U12.4(GND)
VCC/2-4: R19.2 R20.1 SB402.1 SB408.2
VCC_3V3: C21.1 J11.3 R19.1 SB403.1 U11.8(V+) ; port VCC_3V3
VREF_GND: C21.2 C22.2 J11.2 SB401.1 SB409.2 SB411.1 ; port VREF_GND
#rg4: R17.2 U11.2(RG)
*rg4: R17.1 U11.3(RG)
CAP4+: C25.1 U12.5(CFLY+)
CAP4-: C25.2 U12.3(CFLY-)
END4: J13.1 SB406.1 U11.4(IN+)
Measure4: J11.1 LED4.1 U11.7(VOUT) ; port Measure4
MID4: J13.3 SB405.1 U11.1(IN-)
VREF-E4: J13.2 SB407.1 SB408.1 SB409.1 SB410.1
NetC23_2: C23.2 SB403.2 U12.2(IN)
NetC24_2: C24.2 SB404.1 U12.1(OUT)
NetJ12_1: J12.1(Electrode_1) SB405.2
NetJ12_2: J12.2(Electrode_2) SB406.2
NetJ12_3: J12.3(VREF) SB407.2
NetLED4_2: LED4.2 R18.2
NetSB401_2: SB401.2 SB402.2 U11.6(REF)

### Notes on the sheet
- VREF input requires almost 50uA current. This would make the total current of 8 opamps equal to 400uA.
- Place these near AD8221ARZ-R7
- (near U12) SHORT WHILE DUAL SUPPLY
  ELSE OPEN
- For Dual-supply, short VREF_GND SB
- (near J13) ELECTRODES TEST PADS
- For Dual-supply
- For Single-supply
- File:
- Title:
- Date:
- Page
- Num:
- Total:
- Drawn By: Huzaifa Ali

### Library data of the parts
C21 C22 = CC0402KRX5R7BB105: as C11 on sheet Electrode_Sheet2; Supplier 1: Digi-Key; Manufacturer Part Number: CC0402KRX5R7BB105; Stock 1: 1405667; Pricing 1: 1=0.36, 10=0.252, 100=0.1512, 500=0.1134, 1000=0.09576, 2500=0.09072, 5000=0.08568 (USD); Mount: Surface Mount; Case/Package: 0402; Weight: 2.3E-05oz; Case Code (Imperial): 0402; Case Code (Metric): 1005; Min Operating Temperature: -55°C; Max Operating Temperature: 85°C; Capacitance: 1uF; Dielectric: X5R; Packaging: Tape and Reel; Voltage Rating (DC): 16V; Voltage Rating: 16V; Termination: SMD/SMT; Composition: Ceramic; Length: 1mm; Height: 0.5mm; Width: 0.02inch; Thickness: 0.022inch; Depth: 0.5mm; Radiation Hardening: No; Lead Free: Lead Free; Halogen Free: Halogen Free; ComponentLink1URL: http://www.yageo.com/documents/recent/UPY-GPHC_X5R_4V-to-50V_12.pdf?src-supplier=Avnet+Europe; ComponentLink1Description: http://www.yageo.com/documents/recent/UPY-GPHC_X5R_4V-to-50V_12.pdf?src-supplier=Avnet+Europe; Supplier Part Number 1: 311-1691-6-ND; LCSC Part Number: C325464
C23-C25 = CL10A106MA8NRNC: as C13 on sheet Electrode_Sheet2; Supplier 1: Avnet; Manufacturer Part Number: CL10A106MA8NRNC; RoHS: Yes; Category: Ceramic Capacitors; Pricing 1: 4000=0.03753, 8000=0.03700, 16000=0.03595, 24000=0.03515, 32000=0.03383, 40000=0.03304, 400000=0.03225 (USD); Mount: Surface Mount; Case/Package: 0603; Case Code (Metric): 1608; Case Code (Imperial): 0603; Contact Plating: Tin; Min Operating Temperature: -55°C; Max Operating Temperature: 85°C; Package Quantity: 1; Packaging: Tape and Reel; Capacitance: 10uF; Voltage Rating: 25V; Dielectric: X5R; Termination: Wraparound; Series: CL; Construction: Flat; Length: 0.063inch; Width: 0.031inch; Thickness: 0.035inch; Lead Free: Lead Free; RoHS Compliant: Yes; ComponentLink1URL: https://datasheet.ciiva.com/25766/cl10a106ma8nrnc-25766562.pdf?src-supplier=Digi-Key; ComponentLink1Description: https://datasheet.ciiva.com/25766/cl10a106ma8nrnc-25766562.pdf?src-supplier=Digi-Key; Supplier Part Number 1: CL10A106MA8NRNC; LCSC Part Number: C96446
J11 = 4 Pin SMD Wire Connector: as J5 on sheet Electrode_Sheet2; Manufacturer Part Number: 4 Pin SMD Wire Connector
J12 = SEMG PAD: Sensor Connecting Pads
J13 = Test Pad SMD 3 Pin: Test Pad
LED4 = 19-217/S2C-AQ1R1B/3T: as LED2 on sheet Electrode_Sheet2; Supplier 1: Digi-Key; Manufacturer Part Number: 19-217/S2C-AQ1R1B/3T; RoHS: No; Category: LEDs; Supplier Part Number 1: 1080-19-217/S2C-AQ1R1B/3TTR-ND; LCSC Part Number: C146215; ComponentLink1Description: LCSC; ComponentLink1URL: https://www.lcsc.com/product-detail/Light-Emitting-Diodes-LED_Everlight-Elec-19-217-S2C-AQ1R1B-3T_C146215.html
R17 = RC0402FR-07240RL: as R9 on sheet Electrode_Sheet2; Supplier 1: Mouser; Manufacturer Part Number: RC0402FR-07240RL; RoHS: Yes; Category: Chip SMD Resistors; Stock 1: 1903202; Pricing 1: 1=0.10000, 10=0.01200, 50=0.01200, 100=0.00500, 1000=0.00300, 10000=0.00100 (USD); Case/Package: 0402; Case Code (Metric): 1005; Case Code (Imperial): 0402; Size Code: 0402; Min Operating Temperature: -55°C; Max Operating Temperature: 155°C; Resistance: 240R; Tolerance: 1%; Packaging: Tape and Reel; Resistor Type: Thick Film; Voltage Rating: 50V; Package Quantity: 1; Number of Terminations: 2; Termination: SMD/SMT; Max Power Dissipation: 63mW; Features: Moisture Resistant; Series: RC; Construction: Rectangular; Resistance Tolerance: 1%; Length: 1mm; Width: 0.02inch; Height: 0.016inch; Depth: 0.5mm; REACH SVHC: Unknown; Lead Free: Lead Free; RoHS Compliant: Yes; Military Standard: Not; ComponentLink1URL: https://datasheet.ciiva.com/7849/1018594-7849915.pdf?src-supplier=Element14; ComponentLink1Description: https://datasheet.ciiva.com/7849/1018594-7849915.pdf?src-supplier=Element14; ComponentLink2URL: https://datasheet.ciiva.com/7849/1018594-7849916.pdf?src-supplier=Element14; ComponentLink2Description: https://datasheet.ciiva.com/7849/1018594-7849916.pdf?src-supplier=Element14; ComponentLink3URL: https://datasheet.ciiva.com/2519/pyu-r-int-thick-7-2519157.pdf?src-supplier=Digi-Key; ComponentLink3Description: https://datasheet.ciiva.com/2519/pyu-r-int-thick-7-2519157.pdf?src-supplier=Digi-Key; ComponentLink4URL: https://datasheet.ciiva.com/2519/pyu-r-int-thick-7-2519158.pdf?src-supplier=Digi-Key; ComponentLink4Description: https://datasheet.ciiva.com/2519/pyu-r-int-thick-7-2519158.pdf?src-supplier=Digi-Key; ComponentLink5URL: https://datasheet.ciiva.com/2519/pyu-r-int-thick-7-2519156.pdf?src-supplier=Digi-Key; ComponentLink5Description: https://datasheet.ciiva.com/2519/pyu-r-int-thick-7-2519156.pdf?src-supplier=Digi-Key; ComponentLink6URL: https://datasheet.ciiva.com/12669/pyu-rc0402-51-rohs-l-6-r-12669689.pdf?src-supplier=Mouser; ComponentLink6Description: https://datasheet.ciiva.com/12669/pyu-rc0402-51-rohs-l-6-r-12669689.pdf?src-supplier=Mouser; ComponentLink7URL: https://datasheet.ciiva.com/17419/pyu-rc0402-51-rohs-l-6-r-17419482.pdf?src-supplier=Future+Electronics; ComponentLink7Description: https://datasheet.ciiva.com/17419/pyu-rc0402-51-rohs-l-6-r-17419482.pdf?src-supplier=Future+Electronics; Supplier Part Number 1: 603-RC0402FR-07240RL
R18 = RC0402JR-071KL: as R10 on sheet Electrode_Sheet2; Supplier 1: Digi-Key; Manufacturer Part Number: RC0402JR-071KL; RoHS: Yes; Category: Chip SMD Resistors; Stock 1: 452315; Pricing 1: 1=0.10000, 10=0.01300, 100=0.00540, 1000=0.00244, 2500=0.00212, 5000=0.00175 (USD); Case/Package: 0402; Case Code (Imperial): 0402; Case Code (Metric): 1005; Size Code: 0402; Min Operating Temperature: -55°C; Max Operating Temperature: 155°C; Tolerance: 5%; Packaging: Tape and Reel; Package Quantity: 1; Termination: SMD/SMT; Resistor Type: Thick Film; Number of Terminations: 2; Features: Moisture Resistant; Series: RC; Resistance Tolerance: 5%; Construction: Rectangular; Length: 0.039inch; Width: 0.02inch; Height: 0.016inch; Depth: 0.5mm; REACH SVHC: No SVHC; Military Standard: Not; Lead Free: Lead Free; RoHS Compliant: Yes; ComponentLink1URL: https://datasheet.ciiva.com/7983/1018594-7983558.pdf?src-supplier=Element14; ComponentLink1Description: https://datasheet.ciiva.com/7983/1018594-7983558.pdf?src-supplier=Element14; ComponentLink2URL: https://datasheet.ciiva.com/2452/pyu-r-int-thick-7-2452756.pdf?src-supplier=Digi-Key; ComponentLink2Description: https://datasheet.ciiva.com/2452/pyu-r-int-thick-7-2452756.pdf?src-supplier=Digi-Key; ComponentLink3URL: https://datasheet.ciiva.com/2452/pyu-r-int-thick-7-2452757.pdf?src-supplier=Digi-Key; ComponentLink3Description: https://datasheet.ciiva.com/2452/pyu-r-int-thick-7-2452757.pdf?src-supplier=Digi-Key; ComponentLink4URL: https://datasheet.ciiva.com/2452/pyu-r-int-thick-7-2452755.pdf?src-supplier=Digi-Key; ComponentLink4Description: https://datasheet.ciiva.com/2452/pyu-r-int-thick-7-2452755.pdf?src-supplier=Digi-Key; ComponentLink5URL: https://datasheet.ciiva.com/7850/1018594-7850170.pdf?src-supplier=Element14; ComponentLink5Description: https://datasheet.ciiva.com/7850/1018594-7850170.pdf?src-supplier=Element14; ComponentLink6URL: https://datasheet.ciiva.com/7850/1018594-7850171.pdf?src-supplier=Element14; ComponentLink6Description: https://datasheet.ciiva.com/7850/1018594-7850171.pdf?src-supplier=Element14; ComponentLink7URL: https://datasheet.ciiva.com/17081/pyu-rc0402-51-rohs-l-6-r-17081438.pdf?src-supplier=Future+Electronics; ComponentLink7Description: https://datasheet.ciiva.com/17081/pyu-rc0402-51-rohs-l-6-r-17081438.pdf?src-supplier=Future+Electronics; Supplier Part Number 1: 311-1.0KJRCT-ND; LCSC Part Number: C105637
R19 R20 = RC0402JR-07150KL: as R11 on sheet Electrode_Sheet2; Supplier 1: Arrow Electronics; Manufacturer Part Number: RC0402JR-07150KL; RoHS: Yes; Category: Chip SMD Resistors; Stock 1: 170000; Pricing 1: 10000=0.00100 (USD); Case/Package: 0402; Case Code (Metric): 1005; Case Code (Imperial): 0402; Weight: 2.3E-05oz; Size Code: 0402; Min Operating Temperature: -55°C; Max Operating Temperature: 155°C; Package Quantity: 1; Tolerance: 5%; Packaging: Tape and Reel; Resistor Type: Thick Film; Number of Terminations: 2; Termination: SMD/SMT; Max Power Dissipation: 63mW; Features: Moisture Resistant; Series: RC; Construction: Rectangular; Resistance Tolerance: 5%; Length: 1mm; Width: 0.02inch; Height: 0.016inch; Depth: 0.5mm; REACH SVHC: No SVHC; Military Standard: Not; Lead Free: Lead Free; RoHS Compliant: Yes; ComponentLink1URL: https://datasheet.ciiva.com/7983/1018594-7983551.pdf?src-supplier=Element14; ComponentLink1Description: https://datasheet.ciiva.com/7983/1018594-7983551.pdf?src-supplier=Element14; ComponentLink2URL: https://datasheet.ciiva.com/2518/pyu-r-int-thick-7-2518929.pdf?src-supplier=Digi-Key; ComponentLink2Description: https://datasheet.ciiva.com/2518/pyu-r-int-thick-7-2518929.pdf?src-supplier=Digi-Key; ComponentLink3URL: https://datasheet.ciiva.com/2518/pyu-r-int-thick-7-2518930.pdf?src-supplier=Digi-Key; ComponentLink3Description: https://datasheet.ciiva.com/2518/pyu-r-int-thick-7-2518930.pdf?src-supplier=Digi-Key; ComponentLink4URL: https://datasheet.ciiva.com/2518/pyu-r-int-thick-7-2518928.pdf?src-supplier=Digi-Key; ComponentLink4Description: https://datasheet.ciiva.com/2518/pyu-r-int-thick-7-2518928.pdf?src-supplier=Digi-Key; ComponentLink5URL: https://datasheet.ciiva.com/7850/1018594-7850149.pdf?src-supplier=Element14; ComponentLink5Description: https://datasheet.ciiva.com/7850/1018594-7850149.pdf?src-supplier=Element14; ComponentLink6URL: https://datasheet.ciiva.com/17072/pyu-rc0402-51-rohs-l-6-r-17072379.pdf?src-supplier=Future+Electronics; ComponentLink6Description: https://datasheet.ciiva.com/17072/pyu-rc0402-51-rohs-l-6-r-17072379.pdf?src-supplier=Future+Electronics; ComponentLink7URL: https://datasheet.ciiva.com/15189/getdatasheetpartid-251830-15189543.pdf?src-supplier=Verical; ComponentLink7Description: https://datasheet.ciiva.com/15189/getdatasheetpartid-251830-15189543.pdf?src-supplier=Verical; Supplier Part Number 1: RC0402JR-07150KL; LCSC Part Number: C137919
SB401-SB412 = Solder Bridge 0402: Solder Bridge ON; Manufacturer Part Number: Solder Bridge 0402; Item Type: Solder Bridge
U11 = AD8221ARZ-R7: as U7 on sheet Electrode_Sheet2; Supplier 1: Mouser; Manufacturer Part Number: AD8221ARZ-R7; RoHS: Yes; Category: Amplifiers - Op Amps, Buffer, Instrumentation; Pricing 1: 1=7.37000, 10=6.66000, 25=6.35000, 50=6.35000, 100=5.51000, 250=5.27000, 500=4.80000, 1000=4.37000, 10000=4.37000 (USD); Case/Package: SOIC; Number of Pins: 8; Contact Plating: Tin,Matte; Min Operating Temperature: -40°C; Max Operating Temperature: 85°C; -3db Bandwidth: 825kHz; Package Quantity: 1000; Packaging: Tape and Reel; Number of Circuits: 1; Operating Supply Current: 1mA; Number of Elements: 1; Power Dissipation: 200mW; Series: -; Supply Current: 1mA; Radiation Hardening: No; Lead Free: Contains Lead; RoHS Compliant: Yes; ComponentLink1URL: https://datasheet.ciiva.com/15128/getdatasheetpartid-313520-15128733.pdf?src-supplier=Verical; ComponentLink1Description: https://datasheet.ciiva.com/15128/getdatasheetpartid-313520-15128733.pdf?src-supplier=Verical; ComponentLink2URL: https://datasheet.ciiva.com/2975/ad8221-2975658.pdf?src-supplier=Avnet; ComponentLink2Description: https://datasheet.ciiva.com/2975/ad8221-2975658.pdf?src-supplier=Avnet; ComponentLink3URL: https://datasheet.ciiva.com/2975/ad8221-2975980.pdf?src-supplier=Avnet; ComponentLink3Description: https://datasheet.ciiva.com/2975/ad8221-2975980.pdf?src-supplier=Avnet; ComponentLink4URL: https://datasheet.ciiva.com/6628/ad8221-6628618.pdf?src-supplier=Digi-Key; ComponentLink4Description: https://datasheet.ciiva.com/6628/ad8221-6628618.pdf?src-supplier=Digi-Key; ComponentLink5URL: https://datasheet.ciiva.com/6628/ad8221-6628619.pdf?src-supplier=Digi-Key; ComponentLink5Description: https://datasheet.ciiva.com/6628/ad8221-6628619.pdf?src-supplier=Digi-Key; ComponentLink6URL: https://datasheet.ciiva.com/6628/ad8221-6628617.pdf?src-supplier=Digi-Key; ComponentLink6Description: https://datasheet.ciiva.com/6628/ad8221-6628617.pdf?src-supplier=Digi-Key; ComponentLink7URL: https://datasheet.ciiva.com/48709/001249009-da-01-en-ic-amp-inst-prec-ad8221arz-r7-soic-8-adi-48709526.pdf?src-supplier=Conrad; ComponentLink7Description: https://datasheet.ciiva.com/48709/001249009-da-01-en-ic-amp-inst-prec-ad8221arz-r7-soic-8-adi-48709526.pdf?src-supplier=Conrad; Supplier Part Number 1: 584-AD8221ARZ-R7; LCSC Part Number: C13342; Item Type: IC
U12 = SGM3207YN5G/TR: as U8 on sheet Electrode_Sheet2; Supplier 1: Avnet; Manufacturer Part Number: SGM3207YN5G/TR; RoHS: No; Category: Uncategorized; Pricing 1: 3000=0.38750, 6000=0.36250, 12000=0.33750, 18000=0.32500, 24000=0.31250, 30000=0.31250, 300000=0.30500 (USD); LCSC Part Number: C80403; Supplier Part Number 1: SGM3207YN5G/TR